# Altium schematic sheet TOP_LEVEL.SchDoc
size A; SheetNumber: 1; SheetTotal: 8
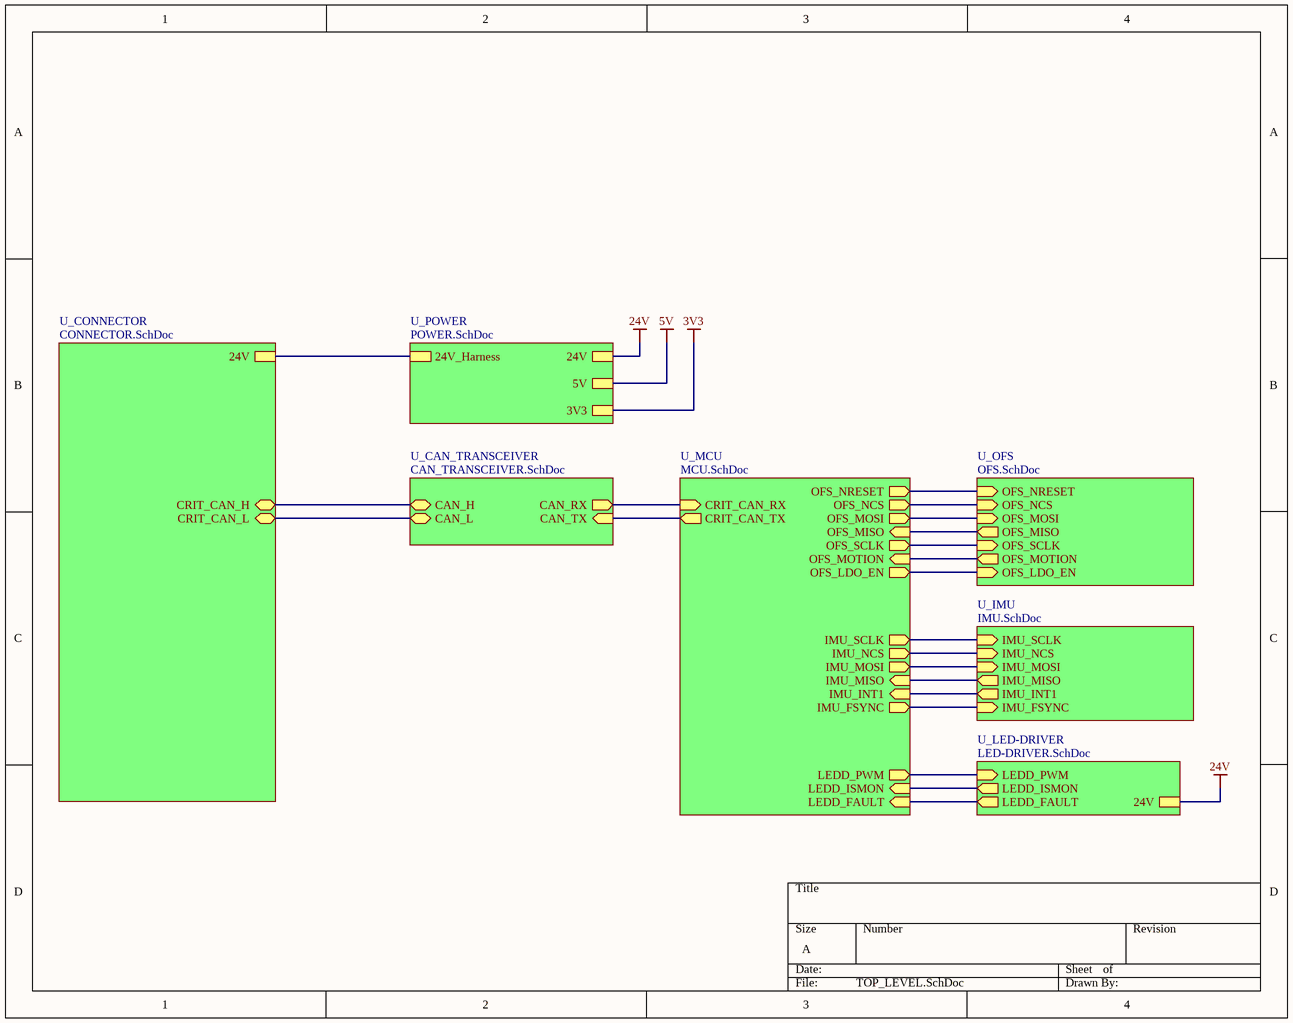
[diagram p0: TOP_LEVEL.SchDoc]

## Sub-sheets
U_CAN_TRANSCEIVER = CAN_TRANSCEIVER.SchDoc: CAN_TX (in), CAN_RX (out), CAN_L (bidir), CAN_H (bidir)
U_CONNECTOR = CONNECTOR.SchDoc: 24V, CRIT_CAN_L (bidir), CRIT_CAN_H (bidir)
U_IMU = IMU.SchDoc: IMU_SCLK (in), IMU_MOSI (in), IMU_MISO (out), IMU_INT1 (out), IMU_FSYNC (in), IMU_NCS (in)
U_LED-DRIVER = LED-DRIVER.SchDoc: LEDD_PWM (in), LEDD_ISMON (out), LEDD_FAULT (out), 24V
U_MCU = MCU.SchDoc: CRIT_CAN_RX (in), CRIT_CAN_TX (out), OFS_NRESET (out), OFS_NCS (out), OFS_MOSI (out), OFS_SCLK (out), OFS_MISO (in), OFS_MOTION (in), OFS_LDO_EN (out), IMU_SCLK (out), IMU_NCS (out), IMU_MOSI (out), IMU_MISO (in), IMU_INT1 (in), IMU_FSYNC (out), LEDD_PWM (out), LEDD_ISMON (in), LEDD_FAULT (in)
U_OFS = OFS.SchDoc: OFS_NRESET (in), OFS_NCS (in), OFS_MOSI (in), OFS_MOTION (out), OFS_LDO_EN (in), OFS_SCLK (in), OFS_MISO (out)
U_POWER = POWER.SchDoc: 24V, 24V_Harness, 5V, 3V3

## Nets
3V3: sheet U_POWER/3V3
5V: sheet U_POWER/5V
24V: sheet U_POWER/24V, sheet U_LED-DRIVER/24V
(unnamed): sheet U_CAN_TRANSCEIVER/CAN_TX, sheet U_MCU/CRIT_CAN_TX
(unnamed): sheet U_CAN_TRANSCEIVER/CAN_RX, sheet U_MCU/CRIT_CAN_RX
(unnamed): sheet U_CAN_TRANSCEIVER/CAN_L, sheet U_CONNECTOR/CRIT_CAN_L
(unnamed): sheet U_CAN_TRANSCEIVER/CAN_H, sheet U_CONNECTOR/CRIT_CAN_H
(unnamed): sheet U_POWER/24V_Harness, sheet U_CONNECTOR/24V
(unnamed): sheet U_MCU/OFS_NRESET, sheet U_OFS/OFS_NRESET
(unnamed): sheet U_MCU/OFS_NCS, sheet U_OFS/OFS_NCS
(unnamed): sheet U_MCU/OFS_MOSI, sheet U_OFS/OFS_MOSI
(unnamed): sheet U_MCU/OFS_SCLK, sheet U_OFS/OFS_SCLK
(unnamed): sheet U_MCU/OFS_MISO, sheet U_OFS/OFS_MISO
(unnamed): sheet U_MCU/OFS_MOTION, sheet U_OFS/OFS_MOTION
(unnamed): sheet U_MCU/OFS_LDO_EN, sheet U_OFS/OFS_LDO_EN
(unnamed): sheet U_MCU/IMU_SCLK, sheet U_IMU/IMU_SCLK
(unnamed): sheet U_MCU/IMU_NCS, sheet U_IMU/IMU_NCS
(unnamed): sheet U_MCU/IMU_MOSI, sheet U_IMU/IMU_MOSI
(unnamed): sheet U_MCU/IMU_MISO, sheet U_IMU/IMU_MISO
(unnamed): sheet U_MCU/IMU_INT1, sheet U_IMU/IMU_INT1
(unnamed): sheet U_MCU/IMU_FSYNC, sheet U_IMU/IMU_FSYNC
(unnamed): sheet U_MCU/LEDD_PWM, sheet U_LED-DRIVER/LEDD_PWM
(unnamed): sheet U_MCU/LEDD_ISMON, sheet U_LED-DRIVER/LEDD_ISMON
(unnamed): sheet U_MCU/LEDD_FAULT, sheet U_LED-DRIVER/LEDD_FAULT